# Altium schematic sheet FR3068E-C_Debug_DEV1.4.SchDoc
size A4; SheetNumber: 3; SheetTotal: 3
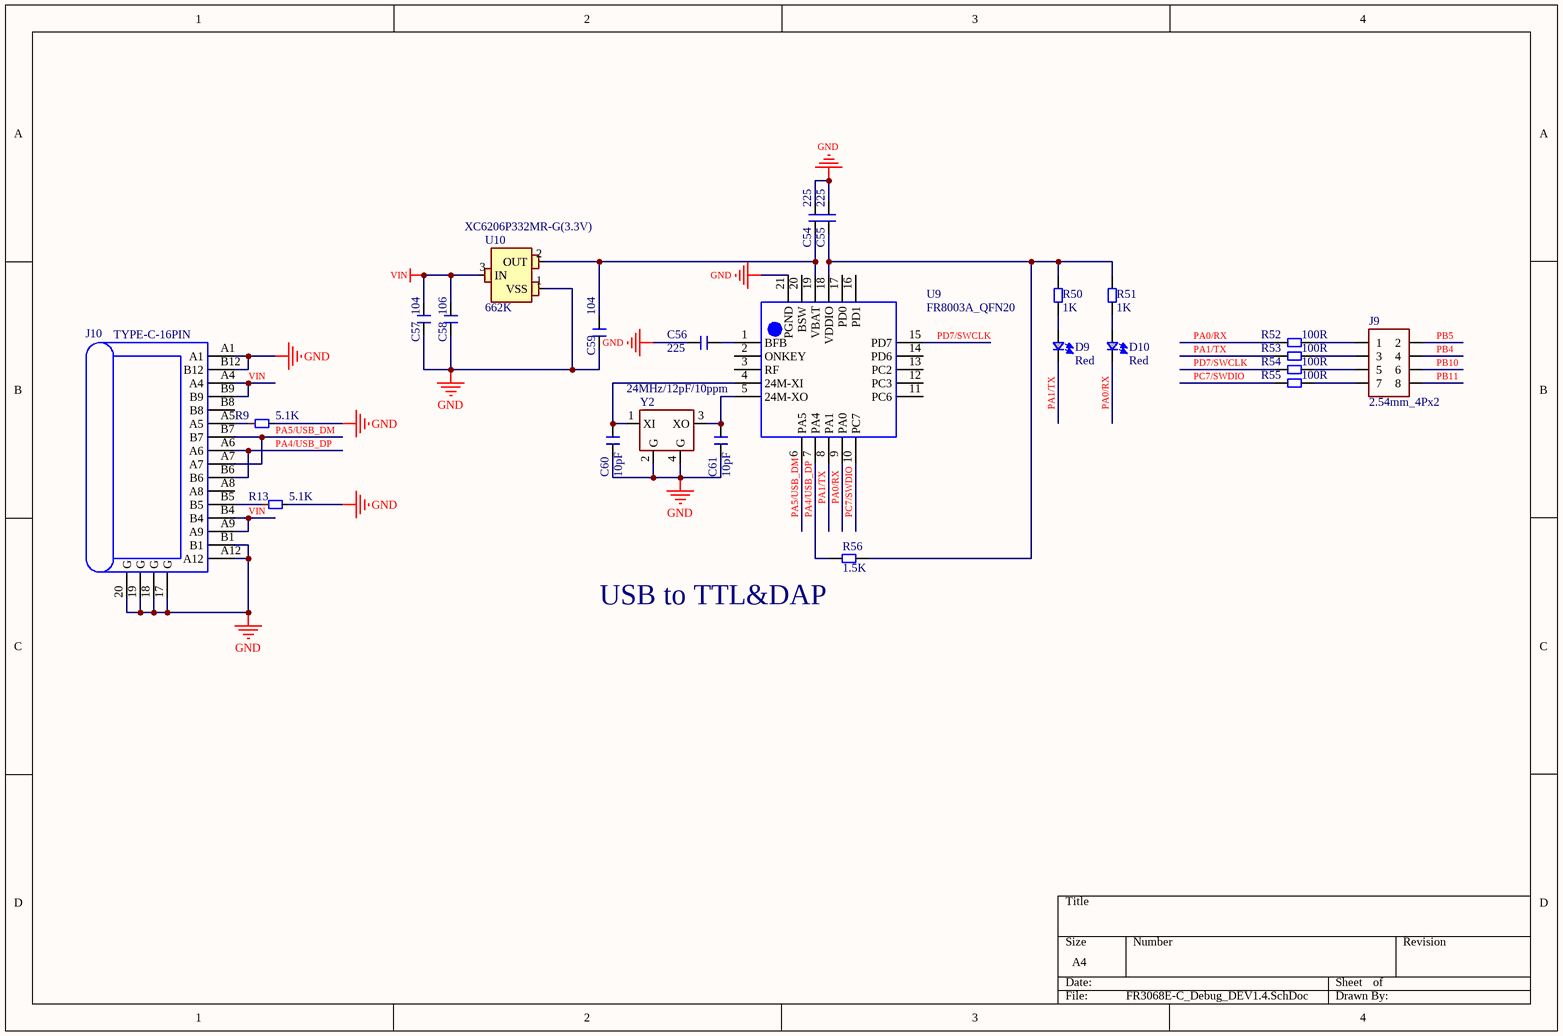
[diagram p0: FR3068E-C_Debug_DEV1.4.SchDoc]

## Parts
C54  225  [C0402]
C55  225  [C0402]
C56  225  [C0402]
C57  104  [C0402]
C58  106  [C0603]
C59  104  [C0402]
C60  10pF  [C0402]
C61  10pF  [C0402]
D9  Red  [D0603]
D10  Red  [D0603]
J9  2.54mm_4Px2  [2.54mm-4Pinx2]
J10  TYPE-C-16PIN  [TYPE_C_L7.35_DIP]
R9  5.1K  [R0402]
R13  5.1K  [R0402]
R50  1K  [R0402]
R51  1K  [R0402]
R52  100R  [R0402]
R53  100R  [R0402]
R54  100R  [R0402]
R55  100R  [R0402]
R56  1.5K  [R0402]
U9  FR8003A_QFN20  [QFN20_3x3_P0.4]
U10  662K  [SOT23]
Y2  24MHz/12pF/10ppm  [CRY3225_4P]

## Nets
GND: C54.2 C55.2 C56.2 C57.1 C58.2 C59.1 C60.1 C61.1 J10.17(G) J10.18(G) J10.19(G) J10.20(G) J10.A1 J10.A12 J10.B1 J10.B12 R9.1 R13.1 U9.21(PGND) U10.1(VSS) Y2.2(G) Y2.4(G)
VIN: C57.2 C58.1 J10.A4 J10.A9 J10.B4 J10.B9 U10.3(IN)
PA0/RX: D10.2 R52.2 U9.9(PA0)
PA1/TX: D9.2 R53.2 U9.8(PA1)
PA4/USB_DP: J10.A6 J10.B6 R56.2 U9.7(PA4)
PA5/USB_DM: J10.A7 J10.B7 U9.6(PA5)
PB4: J9.4
PB5: J9.2
PB10: J9.6
PB11: J9.8
PC7/SWDIO: R55.2 U9.10(PC7)
PD7/SWCLK: R54.2 U9.15(PD7)
NetC54_1: C54.1 C59.2 U9.19(VBAT) U10.2(OUT)
NetC55_1: C55.1 R50.2 R51.2 R56.1 U9.18(VDDIO)
NetC56_1: C56.1 U9.1(BFB)
NetC60_2: C60.2 U9.4(24M-XI) Y2.1(XI)
NetC61_2: C61.2 U9.5(24M-XO) Y2.3(XO)
NetD9_1: D9.1 R50.1
NetD10_1: D10.1 R51.1
NetJ9_1: J9.1 R52.1
NetJ9_3: J9.3 R53.1
NetJ9_5: J9.5 R54.1
NetJ9_7: J9.7 R55.1
NetJ10_A5: J10.A5 R9.2
NetJ10_B5: J10.B5 R13.2

Not connected (* = marked no-connect by the designer): J10 A8 B8; U9 2(ONKEY) 3(RF) 11(PC6) 12(PC3) 13(PC2) 14(PD6) 16(PD1) 17(PD0) 20(BSW)

## Notes on the sheet
- (near U10) XC6206P332MR-G(3.3V)
- (near R56) USB to TTL&DAP

## Library data of the parts
C54-C56 C60 C61 = C: PartName: 贴片电容
C57-C59 = C
D9 D10 = LED
J10 = TYPE-C-16PIN: 沉板
R9 R13 R50-R56 = R
Y2 = CRY3225